# Altium schematic sheet IMU.SchDoc
size A4; SheetNumber: 6; SheetTotal: 7
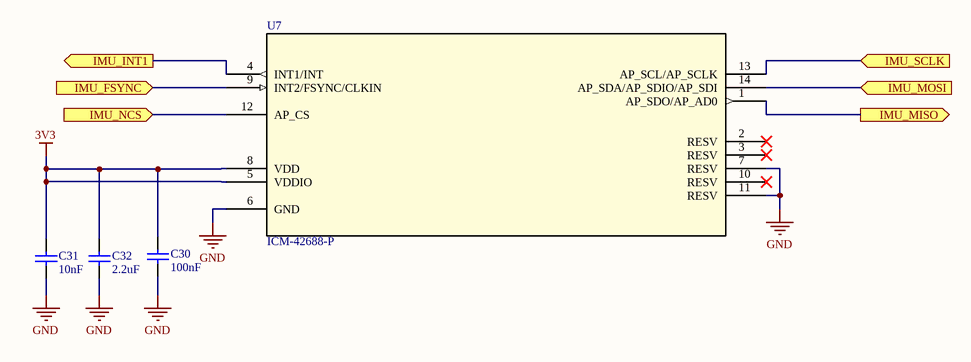
[diagram p0: IMU.SchDoc]

## Parts
C30  value 100nF  [0603_CAP]  (hidden comment: Capacitor)
C31  value 10nF  [0603_CAP]  (hidden comment: Capacitor)
C32  value 2.2uF  [0603_CAP]  (hidden comment: Capacitor)
U7  ICM-42688-P  [LGA14_2P5X3X0P91_TDK]

## Ports
IMU_FSYNC (in, see TOP-LEVEL[4C], MCU[2C]), IMU_INT1 (out, see TOP-LEVEL[4C], MCU[1D]), IMU_MISO (out, see TOP-LEVEL[4C], MCU[1D]), IMU_MOSI (in, see TOP-LEVEL[4C], MCU[1D]), IMU_NCS (in, see TOP-LEVEL[4C], MCU[1D]), IMU_SCLK (in, see TOP-LEVEL[4C], MCU[1D])

## Nets
3V3: C30.2 C31.2 C32.2 U7.5(VDDIO) U7.8(VDD)
GND: C30.1 C31.1 C32.1 U7.6(GND) U7.7(RESV) U7.11(RESV)
IMU_FSYNC: U7.9(INT2/FSYNC/CLKIN) ; port IMU_FSYNC
IMU_INT1: U7.4(INT1/INT) ; port IMU_INT1
IMU_MISO: U7.1(AP_SDO/AP_AD0) ; port IMU_MISO
IMU_MOSI: U7.14(AP_SDA/AP_SDIO/AP_SDI) ; port IMU_MOSI
IMU_NCS: U7.12(AP_CS) ; port IMU_NCS
IMU_SCLK: U7.13(AP_SCL/AP_SCLK) ; port IMU_SCLK

Not connected (* = marked no-connect by the designer): U7 2(RESV)* 3(RESV)* 10(RESV)*

## Library data of the parts
C30-C32 = Capacitor: SimulationGenericComponent: True
U7 = ICM-42688-P: Description; Manufacturer_Name: TDK; Type: Motion Sensors; Copyright: Copyright (C) 2025 Ultra Librarian. All rights reserved.; Manufacturer_Part_Number: ICM-42688-P; RefDes: RefDes